# Altium project CarrierBoard-v1.0.PrjPcb (part 1 of 2)
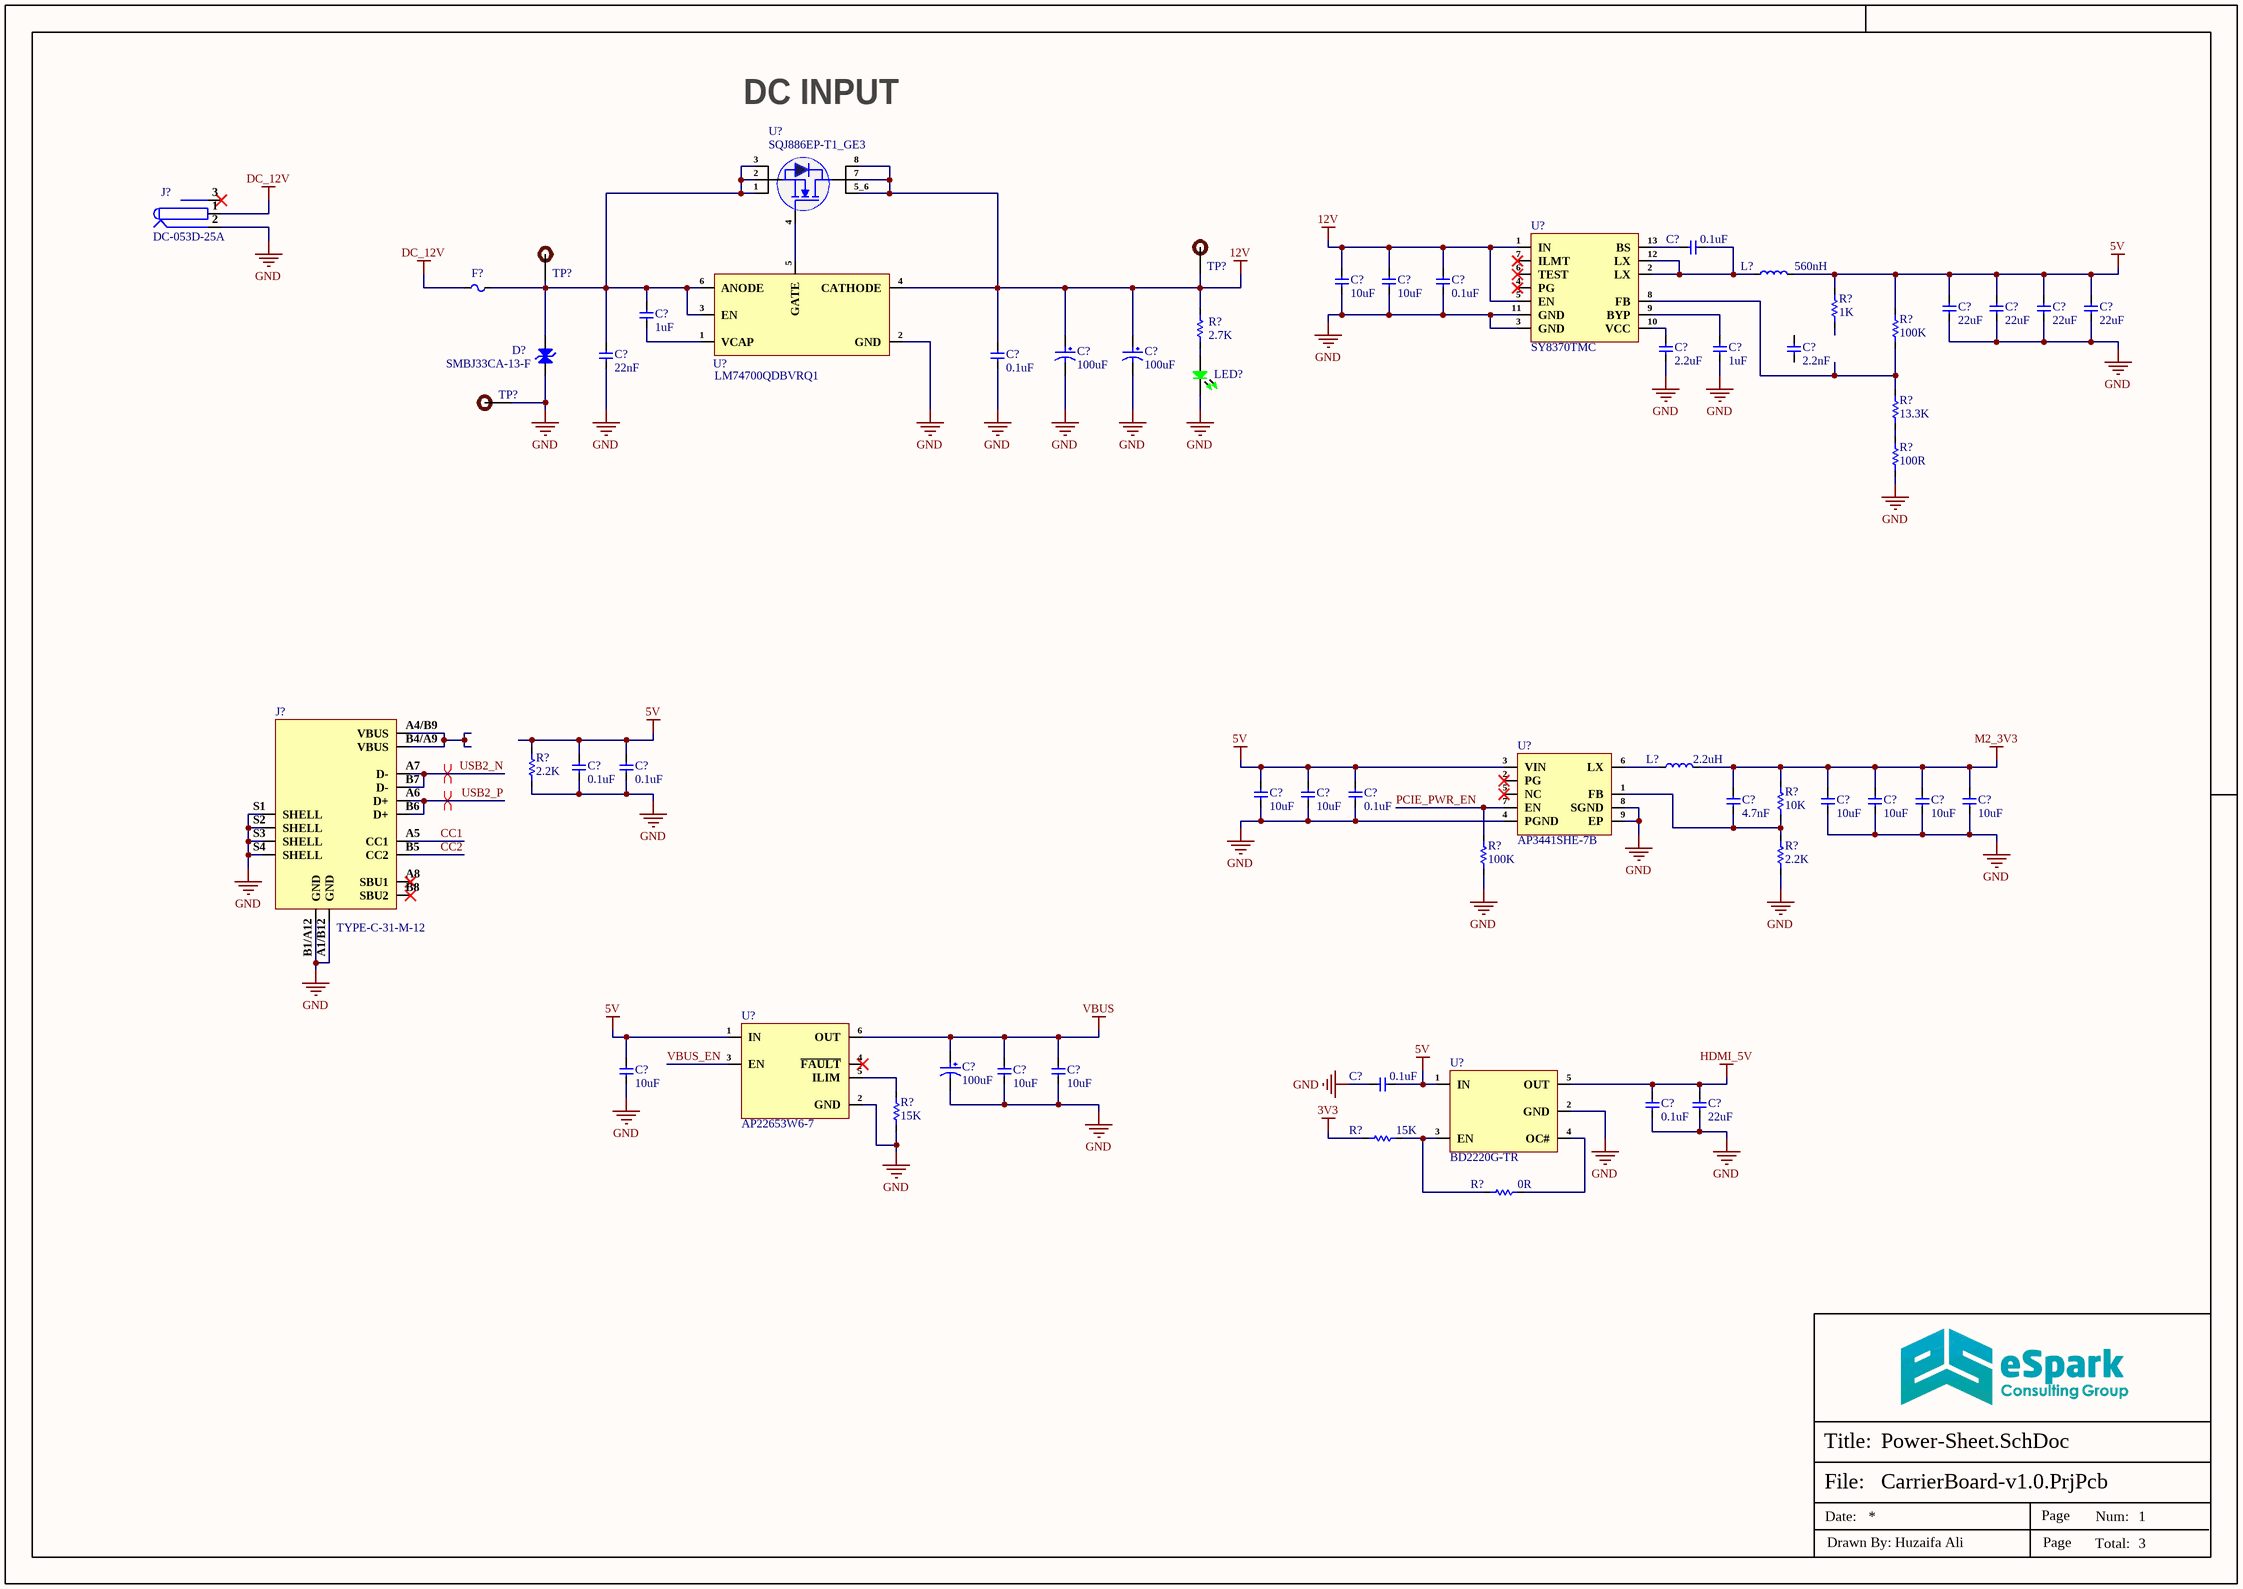
[diagram p0: Power-Sheet.SchDoc]
3 sheets, 66 parts. Net scope: global (net labels, ports and power ports of the same name join across sheets).
Sheets:
  Power-Sheet.SchDoc
  Compute-Module-Sheet-1.SchDoc
  Compute-Module-Sheet-2.SchDoc

## Sheet Power-Sheet.SchDoc
size 420 x 297 mm; SheetNumber: 1; SheetTotal: 3

### Parts
(Parts that share a designator on the sheet are numbered #1, #2 ... from top to bottom, then left to right.)
C?#1  0.1uF  [Cap-0402]
C?#2  10uF  [Cap-0805]
C?#3  10uF  [Cap-0805]
C?#4  0.1uF  [Cap-0402]
C?#5  22uF  [Cap-0805]
C?#6  22uF  [Cap-0805]
C?#7  22uF  [Cap-0805]
C?#8  22uF  [Cap-0805]
C?#9  1uF  [Cap-0402]
C?#10  100uF  [EEE-FK1E101XP]
C?#11  100uF  [EEE-FK1E101XP]
C?#12  2.2uF  [Cap-0402]
C?#13  0.1uF  [Cap-0402]
C?#14  1uF  [Cap-0402]
C?#15  2.2nF  [Cap-0402]
C?#16  22nF  [Cap-0603]
C?#17  0.1uF  [Cap-0402]
C?#18  0.1uF  [Cap-0402]
C?#19  10uF  [Cap-0805]
C?#20  10uF  [Cap-0805]
C?#21  0.1uF  [Cap-0402]
C?#22  4.7nF  [Cap-0402]
C?#23  10uF  [Cap-0805]
C?#24  10uF  [Cap-0805]
C?#25  10uF  [Cap-0805]
C?#26  10uF  [Cap-0805]
C?#27  100uF  [EEE-FK1E101XP]
C?#28  10uF  [Cap-0805]
C?#29  10uF  [Cap-0805]
C?#30  10uF  [Cap-0805]
C?#31  0.1uF  [Cap-0402]
C?#32  0.1uF  [Cap-0402]
C?#33  22uF  [Cap-0805]
D?  SMBJ33CA-13-F  [SMB Bi Directional]
F?  2920L500/16MR  [Fuse-2920]  (value not drawn)
J?#1  DC-053D-25A  [DC-053D-25A]
J?#2  TYPE-C-31-M-12  [TYPE-C-31-M-12_]
L?#1  560nH  [FAUL0630-R56MT]
L?#2  2.2uH  [HMS0603-2R2]
LED?  GREEN  [LED-0603]  (value not drawn)
R?#1  2.7K  [Res-0603]
R?#2  1K  [Res-0402]
R?#3  100K  [Res-0402]
R?#4  13.3K  [Res-0402]
R?#5  100R  [Res-0402]
R?#6  2.2K  [Res-0402]
R?#7  10K  [Res-0402]
R?#8  100K  [Res-0402]
R?#9  2.2K  [Res-0402]
R?#10  15K  [Res-0402]
R?#11  15K  [Res-0402]
R?#12  0R  [Res-0402]
TP?#1  TEST POINT  [Test-point]  (value not drawn)  (no BOM)
TP?#2  TEST POINT  [Test-point]  (value not drawn)  (no BOM)
TP?#3  TEST POINT  [Test-point]  (value not drawn)  (no BOM)
U?#1  SQJ886EP-T1_GE3  [PowerPAK-SO-8]
U?#2  SY8370TMC  [QFN-13(3x4)]
U?#3  LM74700QDBVRQ1  [SOT-23-6]
U?#4  AP3441SHE-7B  [DFN2020-8-EP]
U?#5  AP22653W6-7  [SOT-26]
U?#6  BD2220G-TR  [SSOP-5]

### Nets
3V3: R?#11.2
5V: C?#5.2 C?#6.2 C?#7.2 C?#8.2 C?#17.2 C?#18.2 C?#19.2 C?#20.2 C?#21.2 C?#28.2 C?#31.1 L?#1.2 R?#2.2 R?#3.2 R?#6.2 U?#4.3(VIN) U?#5.1(IN) U?#6.1(IN)
12V: C?#2.2 C?#3.2 C?#4.2 C?#10.1 C?#11.1 C?#13.2 R?#1.1 TP?#1.1 U?#1.5_6(D) U?#1.7(D) U?#1.8(D) U?#2.1(IN) U?#2.5(EN) U?#3.4(CATHODE)
DC_12V: F?.1 J?#1.1
GND: C?#2.1 C?#3.1 C?#4.1 C?#5.1 C?#6.1 C?#7.1 C?#8.1 C?#10.2 C?#11.2 C?#12.1 C?#13.1 C?#14.1 C?#16.1 C?#17.1 C?#18.1 C?#19.1 C?#20.1 C?#21.1 C?#23.1 C?#24.1 C?#25.1 C?#26.1 C?#27.2 C?#28.1 C?#29.1 C?#30.1 C?#31.2 C?#32.1 C?#33.1 D?.1(A) J?#1.2 J?#2.A1/B12(GND) J?#2.B1/A12(GND) J?#2.S1(SHELL) J?#2.S2(SHELL) J?#2.S3(SHELL) J?#2.S4(SHELL) LED?.2 R?#5.1 R?#6.1 R?#8.1 R?#9.1 R?#10.1 TP?#3.1 U?#2.3(GND) U?#2.11(GND) U?#3.2(GND) U?#4.4(PGND) U?#4.8(SGND) U?#4.9(EP) U?#5.2(GND) U?#6.2(GND)
HDMI_5V: C?#32.2 C?#33.2 U?#6.5(OUT)
M2_3V3: C?#22.2 C?#23.2 C?#24.2 C?#25.2 C?#26.2 L?#2.2 R?#7.2
VBUS: C?#27.1 C?#29.2 C?#30.2 U?#5.6(OUT)
CC1: J?#2.A5(CC1)
CC2: J?#2.B5(CC2)
PCIE_PWR_EN: R?#8.2 U?#4.7(EN)
USB2_N: J?#2.A7(D-) J?#2.B7(D-)
USB2_P: J?#2.A6(D+) J?#2.B6(D+)
VBUS_EN: U?#5.3(EN)
NetC?#1_1: C?#1.1 L?#1.1 U?#2.2(LX) U?#2.12(LX)
NetC?#1_2: C?#1.2 U?#2.13(BS)
NetC?#9_1: C?#9.1 U?#3.1(VCAP)
NetC?#9_2: C?#9.2 C?#16.2 D?.2(K) F?.2 TP?#2.1 U?#1.1(S) U?#1.2(S) U?#1.3(S) U?#3.3(EN) U?#3.6(ANODE)
NetC?#12_2: C?#12.2 U?#2.10(VCC)
NetC?#14_2: C?#14.2 U?#2.9(BYP)
NetC?#22_1: C?#22.1 R?#7.1 R?#9.2 U?#4.1(FB)
NetJ?#2_A4/B9: J?#2.A4/B9(VBUS) J?#2.B4/A9(VBUS)
NetL?#2_1: L?#2.1 U?#4.6(LX)
NetLED?_1: LED?.1 R?#1.2
NetR?#3_1: R?#3.1 R?#4.2 U?#2.8(FB)
NetR?#4_1: R?#4.1 R?#5.2
NetR?#10_2: R?#10.2 U?#5.5(ILIM)
NetR?#11_1: R?#11.1 R?#12.1 U?#6.3(EN)
NetR?#12_2: R?#12.2 U?#6.4(OC#)
NetU?#1_4: U?#1.4(G) U?#3.5(GATE)

Not connected (* = marked no-connect by the designer): C?#15 1 2; J?#1 3*; J?#2 A8(SBU1)* B8(SBU2)*; R?#2 1; U?#2 4(PG)* 6(TEST)* 7(ILMT)*; U?#4 2(PG)* 5(NC)*; U?#5 4(~{FAULT})*

### Layout directives
differential pair: USB2_N, USB2_P

### Notes on the sheet
- DC INPUT
- File:
- Title:
- Date:
- Page
- Num:
- Total:
- Drawn By: Huzaifa Ali

### Library data of the parts
C?#1 C?#4 C?#13 C?#17 C?#18 C?#21 C?#31 C?#32 = GCM155R71H104KE02D: CAP CER 0.1UF 50V X7R 0402; Manufacturer: Murata; Item Type: Capacitors; Material: 4241ConductorMaterial; Value: 100nF; Tolerance: 10%; Supplier: Mouser; LCSC Part Number: C85858; Manufacturer Part Number: GCM155R71H104KE02D; RoHS: Yes; Stock: 400191; Pricing: 1=0.1, 10=0.023, 50=0.023, 100=0.014, 1000=0.012, 10000=0.007 (USD); Mounting Technology: Surface Mount; Case/Package: 0402; Case Code (Metric): 1005; Case Code (Imperial): 0402; Weight: 0.000212oz; Min Operating Temperature: -55°C; Max Operating Temperature: 125°C; Packaging: Tape and Reel; Voltage Rating: 50V; Dielectric: X7R; Termination: SMD/SMT; Voltage Rating (DC): 50V; Package Quantity: 10000; Series: GCM; Length: 0.039inch; Width: 0.02inch; Height: 0.5mm; Thickness: 0.022inch; Ratings: AEC-Q200; Reach SVHC Compliant: No; RoHS Compliant: Yes; Lead Free: 5697LeadFree; ComponentLink1URL: http://www.farnell.com/datasheets/2079122.pdf?src-supplier=Farnell; ComponentLink1Description: http://www.farnell.com/datasheets/2079122.pdf?src-supplier=Farnell; ComponentLink2URL: http://www.mouser.com/ds/2/281/c03e-806517.pdf?src-supplier=Mouser; ComponentLink2Description: http://www.mouser.com/ds/2/281/c03e-806517.pdf?src-supplier=Mouser; ComponentLink3URL: https://datasheet.octopart.com/GCM155R71H104KE02D-Murata-datasheet-12524712.pdf?src-supplier=Future+Electronics; ComponentLink3Description: https://datasheet.octopart.com/GCM155R71H104KE02D-Murata-datasheet-12524712.pdf?src-supplier=Future+Electronics; ComponentLink4URL: http://search.murata.co.jp/Ceramy/image/img/A01X/partnumbering_e_02.pdf?src-supplier=Digikey; ComponentLink4Description: http://search.murata.co.jp/Ceramy/image/img/A01X/partnumbering_e_02.pdf?src-supplier=Digikey; ComponentLink5URL: https://datasheet.octopart.com/GCM155R71H104KE02D-Murata-datasheet-66077033.pdf?src-supplier=Element14; ComponentLink5Description: https://datasheet.octopart.com/GCM155R71H104KE02D-Murata-datasheet-66077033.pdf?src-supplier=Element14; ComponentLink6URL: https://datasheet.octopart.com/GCM155R71H104KE02D-Murata-datasheet-149522465.pdf?src-supplier=Farnell; ComponentLink6Description: https://datasheet.octopart.com/GCM155R71H104KE02D-Murata-datasheet-149522465.pdf?src-supplier=Farnell; ComponentLink7URL: http://www.farnell.com/datasheets/2079122.pdf?src-supplier=Element14; ComponentLink7Description: http://www.farnell.com/datasheets/2079122.pdf?src-supplier=Element14; ComponentLink8URL: http://www.farnell.com/datasheets/2079122.pdf?src-supplier=Newark; ComponentLink8Description: http://www.farnell.com/datasheets/2079122.pdf?src-supplier=Newark; ComponentLink9URL: https://datasheet.octopart.com/GCM155R71H104KE02D-Murata-datasheet-165579661.pdf?src-supplier=TME; ComponentLink9Description: https://datasheet.octopart.com/GCM155R71H104KE02D-Murata-datasheet-165579661.pdf?src-supplier=TME
C?#2 C?#3 C?#19 C?#20 C?#23-C?#26 C?#28-C?#30 = GRM21BZ71E106KE15L: CAP CER 10UF 25V X7R 0805; Manufacturer: Murata; Item Type: Capacitors; Material: 4241ConductorMaterial; Tolerance: 10%; Supplier: Mouser; LCSC Part Number: C237493; Manufacturer Part Number: GRM21BZ71E106KE15L; RoHS: Yes; Stock: 43117; Pricing: 1=0.34, 10=0.142, 50=0.142, 100=0.096, 1000=0.086, 10000=0.058 (USD); Case/Package: 339Case; Min Operating Temperature: -55°C; Max Operating Temperature: 125°C; Value: 10uF; Voltage Rating: 25V; Length: 2mm; Width: 1.25mm; Height: 1.45mm; Thickness: 1.25mm; RoHS Compliant: Yes
C?#5-C?#8 C?#33 = GRM21BZ71A226ME15L: CAP CER 22UF 10V X7R 0805; Manufacturer: Murata; Material: 4241ConductorMaterial; Tolerance: 20%; Item Type: Capacitor; Supplier: Digi-Key; Supplier Part Number: 490-GRM21BZ71A226ME15LCT-ND; Manufacturer Part Number: GRM21BZ71A226ME15L; RoHS: Yes; Category: Ceramic Capacitors; Stock: 49126; Pricing: 1=0.39, 10=0.259, 50=0.191, 100=0.1556, 500=0.12282, 1000=0.10372 (USD); Package: 0805; Min Operating Temperature: -55°C; Max Operating Temperature: 125°C; Value: 22uF; Voltage Rating: 10V; Length: 2mm; Width: 1.25mm; Height: 1.45mm; Thickness: 1.25mm; ComponentLink1URL: https://datasheet.octopart.com/GRM21BZ71A226ME15L-Murata-datasheet-165579666.pdf?src-supplier=TME; ComponentLink1Description: https://datasheet.octopart.com/GRM21BZ71A226ME15L-Murata-datasheet-165579666.pdf?src-supplier=TME; LCSC Part Number: C907991; ComponentLink2Description: LCSC; ComponentLink2URL: https://www.lcsc.com/product-detail/Multilayer-Ceramic-Capacitors-MLCC-SMD-SMT_Murata-Electronics-GRM21BZ71A226ME15L_C907991.html
C?#9 C?#14 = CC0402KRX5R8BB105: CAP CER 1UF 25V X5R 0402; Manufacturer: Yageo; Tolerance: 10%; Supplier 1: Mouser; Manufacturer Part Number: CC0402KRX5R8BB105; RoHS: Yes; Category: Ceramic Capacitors; Stock 1: 91975; Pricing 1: 1=0.30000, 10=0.20400, 50=0.20400, 100=0.11600, 1000=0.07200, 10000=0.05900 (USD); Mount: Surface Mount; Case/Package: 0402; Case Code (Metric): 1005; Case Code (Imperial): 0402; Weight: 2.3E-05oz; Min Operating Temperature: -55°C; Max Operating Temperature: 85°C; Packaging: Tape and Reel; Capacitance: 1uF; Voltage Rating: 25V; Dielectric: X5R; Termination: SMD/SMT; Voltage Rating (DC): 25V; Package Quantity: 10000; Length: 0.039inch; Width: 0.02inch; Thickness: 0.022inch; Lead Free: Lead Free; Halogen Free: Halogen Free; RoHS Compliant: Yes; ComponentLink1URL: http://www.mouser.com/ds/2/447/Yageo_UPY-GP_NP0_16V-to-50V_9-358835.pdf?src-supplier=Mouser; ComponentLink1Description: http://www.mouser.com/ds/2/447/Yageo_UPY-GP_NP0_16V-to-50V_9-358835.pdf?src-supplier=Mouser; ComponentLink2URL: http://www.yageo.com/documents/recent/UPY-GPHC_X5R_4V-to-50V_25.pdf?src-supplier=Digi-Key; ComponentLink2Description: http://www.yageo.com/documents/recent/UPY-GPHC_X5R_4V-to-50V_25.pdf?src-supplier=Digi-Key; ComponentLink3URL: https://4donline.ihs.com/images/VipMasterIC/IC/YAGO/YAGO-S-A0006851646/YAGO-S-A0006851646-1.pdf?hkey=6D3A4C79FDBF58556ACFDE234799DDF0&src-supplier=Newark; ComponentLink3Description: https://4donline.ihs.com/images/VipMasterIC/IC/YAGO/YAGO-S-A0006851646/YAGO-S-A0006851646-1.pdf?hkey=6D3A4C79FDBF58556ACFDE234799DDF0&src-supplier=Newark; Supplier Part Number 1: 603-CC402KRX5R8BB105; LCSC Part Number: C326568
C?#10 C?#11 C?#27 = EEE-FK1E101XP: CAP ALUM 100UF 20% 25V SMD; Manufacturer: Panasonic; Item Type: Capacitor; Ripple Current: 280mA; ESR (Equivalent Series Resistance): 340mR; Life (Hours): 2000Hour; Leakage Current: 3uA; Lead Diameter: 0.65mm; Supplier: Mouser; LCSC Part Number: C128510; Manufacturer Part Number: EEE-FK1E101XP; RoHS: Yes; Stock: 18001; Pricing: 1=0.56, 10=0.293, 50=0.293, 100=0.263, 1000=0.168, 10000=0.147 (USD); Mounting Technology: Surface Mount,PCB; Case/Package: Radial; Pins: 8; Min Operating Temperature: -55°C; Max Operating Temperature: 105°C; Tolerance: 20%; Value: 100uF; Voltage Rating (DC): 25V; Packaging: Tape and Reel; Voltage Rating: 25V; Ripple Current (AC): 280mA; Impedance: 340mR; Package Quantity: 1; Termination: SMD/SMT; Voltage: 25V; Series: FK; Construction: Cylindrical; Diameter: 6.3mm; Length: 7.7mm; Width: 7.8mm; Height: 7.7mm; Lead Pitch: 1.8mm; Height - Seated (Max): 0.303inch; Ratings: AEC-Q200; Radiation Hardening: No; Reach SVHC Compliant: No; RoHS Compliant: Yes; Lead Free: 5697LeadFree; ComponentLink1URL: https://datasheet.ciiva.com/11777/0900766b80e4e8b0-11777232.pdf?src-supplier=Rs; ComponentLink1Description: https://datasheet.ciiva.com/11777/0900766b80e4e8b0-11777232.pdf?src-supplier=Rs; ComponentLink2URL: https://datasheet.ciiva.com/2983/aba0000ce120-2983949.pdf?src-supplier=Avnet; ComponentLink2Description: https://datasheet.ciiva.com/2983/aba0000ce120-2983949.pdf?src-supplier=Avnet; ComponentLink3URL: https://datasheet.ciiva.com/46386/1676921-46386184.pdf?src-supplier=Element14; ComponentLink3Description: https://datasheet.ciiva.com/46386/1676921-46386184.pdf?src-supplier=Element14; ComponentLink4URL: https://datasheet.ciiva.com/46376/1676921-46376486.pdf?src-supplier=Element14; ComponentLink4Description: https://datasheet.ciiva.com/46376/1676921-46376486.pdf?src-supplier=Element14; ComponentLink5URL: https://datasheet.ciiva.com/43463/58258-43463513.pdf?src-supplier=Farnell; ComponentLink5Description: https://datasheet.ciiva.com/43463/58258-43463513.pdf?src-supplier=Farnell; ComponentLink6URL: https://datasheet.ciiva.com/46386/58258-46386183.pdf?src-supplier=Element14; ComponentLink6Description: https://datasheet.ciiva.com/46386/58258-46386183.pdf?src-supplier=Element14; ComponentLink7URL: https://datasheet.ciiva.com/28678/731857-28678871.pdf?src-supplier=Element14; ComponentLink7Description: https://datasheet.ciiva.com/28678/731857-28678871.pdf?src-supplier=Element14; ComponentLink8URL: https://datasheet.ciiva.com/24023/aba0000ce120-24023434.pdf?src-supplier=Mouser; ComponentLink8Description: https://datasheet.ciiva.com/24023/aba0000ce120-24023434.pdf?src-supplier=Mouser; ComponentLink9URL: https://datasheet.ciiva.com/14594/70258115-14594399.pdf?src-supplier=Allied+Electronics; ComponentLink9Description: https://datasheet.ciiva.com/14594/70258115-14594399.pdf?src-supplier=Allied+Electronics; ComponentLink10URL: https://datasheet.ciiva.com/2983/aba0000ce120-2983950.pdf?src-supplier=Avnet; ComponentLink10Description: https://datasheet.ciiva.com/2983/aba0000ce120-2983950.pdf?src-supplier=Avnet; ComponentLink11URL: https://datasheet.ciiva.com/16449/aba0000ce120-16449109.pdf?src-supplier=Future+Electronics; ComponentLink11Description: https://datasheet.ciiva.com/16449/aba0000ce120-16449109.pdf?src-supplier=Future+Electronics
C?#12 = GRM155R61C225KE11D: CAP CER 2.2UF 16V X5R 0402; Manufacturer: Murata; Item Type: Capacitors; Material: Ceramic; Tolerance: 10%; Supplier: Future Electronics; LCSC Part Number: C88944; Manufacturer Part Number: GRM155R61C225KE11D; RoHS: Yes; Stock: 80000; Pricing: 10000=0.0294, 20000=0.0289, 30000=0.0287, 40000=0.0285, 50000=0.0279 (USD); Mounting Technology: Surface Mount; Case/Package: 0402; Case Code (Metric): 1005; Case Code (Imperial): 0402; Min Operating Temperature: -55°C; Max Operating Temperature: 85°C; Value: 2.2uF; Packaging: Cut Tape; Voltage Rating: 16V; Voltage Rating (DC): 16V; Series: GRM; Length: 0.039inch; Width: 0.02inch; Height: 0.3mm; Thickness: 0.022inch; Lead Free: Lead Free; RoHS Compliant: Yes; ComponentLink1URL: http://www.mouser.com/ds/2/281/c02e-2905.pdf?src-supplier=Mouser; ComponentLink1Description: http://www.mouser.com/ds/2/281/c02e-2905.pdf?src-supplier=Mouser; ComponentLink2URL: https://datasheet.octopart.com/GRM155R61C225KE11D-Murata-datasheet-149522998.pdf?src-supplier=Newark; ComponentLink2Description: https://datasheet.octopart.com/GRM155R61C225KE11D-Murata-datasheet-149522998.pdf?src-supplier=Newark; ComponentLink3URL: https://datasheet.octopart.com/GRM155R61C225KE11D-Murata-datasheet-66001083.pdf?src-supplier=Future+Electronics; ComponentLink3Description: https://datasheet.octopart.com/GRM155R61C225KE11D-Murata-datasheet-66001083.pdf?src-supplier=Future+Electronics; ComponentLink4URL: https://search.murata.co.jp/Ceramy/image/img/A01X/G101/ENG/GRM155R61C225KE11-01.pdf?src-supplier=Digikey; ComponentLink4Description: https://search.murata.co.jp/Ceramy/image/img/A01X/G101/ENG/GRM155R61C225KE11-01.pdf?src-supplier=Digikey; ComponentLink5URL: https://datasheet.octopart.com/GRM155R61C225KE11D-Murata-datasheet-165579666.pdf?src-supplier=TME; ComponentLink5Description: https://datasheet.octopart.com/GRM155R61C225KE11D-Murata-datasheet-165579666.pdf?src-supplier=TME
C?#15 = 04025C222JAT2A: CAP CER 2.2nF 50V X7R ±5% 0402 MLCC - SMD/SMT ROHS; Manufacturer: Kyocera AVX; Item Type: Capacitor; Manufacturer Part Number: 04025C222JAT2A; Package: 0402; LCSC Part Number: C597041; ComponentLink1Description: LCSC; ComponentLink1URL: https://www.lcsc.com/product-detail/Multilayer-Ceramic-Capacitors-MLCC-SMD-SMT_Kyocera-AVX-04025C222JAT2A_C597041.html
C?#16 = CC0603KRX7R9BB223: CAP CER 0.022UF 50V X7R 0603; Manufacturer: Yageo; Dielectric Material: Ceramic; Tolerance: 10%; Insulation Resistance: 100GR; Item Type: Capacitor; Supplier 1: Digi-Key; Manufacturer Part Number: CC0603KRX7R9BB223; RoHS: Yes; Category: Ceramic Capacitors; Stock 1: 119735; Pricing 1: 1=0.10000, 10=0.05500, 50=0.03020, 100=0.02460, 500=0.01760, 1000=0.01383 (USD); Mount: Surface Mount; Case/Package: 0603; Number of Pins: 2; Case Code (Metric): 1608; Case Code (Imperial): 0603; Min Operating Temperature: -55°C; Max Operating Temperature: 125°C; Capacitance: 22nF; Dielectric: X7R; Voltage: 50V; Package Quantity: 1; Voltage Rating: 50V; Packaging: Tape and Reel; Voltage Rating (DC): 50V; Termination: SMD/SMT; Resistor Type: Ceramic; Series: CC; Length: 1.6mm; Width: 0.031inch; Height: 0.8mm; Depth: 0.8mm; Thickness: 0.035inch; Radiation Hardening: No; RoHS Compliant: Yes; REACH SVHC: No SVHC; Lead Free: Lead Free; Halogen Free: Halogen Free; ComponentLink1URL: https://datasheet.ciiva.com/8033/70765-8033869.pdf?src-supplier=Element14; ComponentLink1Description: https://datasheet.ciiva.com/8033/70765-8033869.pdf?src-supplier=Element14; ComponentLink2URL: https://datasheet.ciiva.com/28450/1489800-28450639.pdf?src-supplier=Element14; ComponentLink2Description: https://datasheet.ciiva.com/28450/1489800-28450639.pdf?src-supplier=Element14; ComponentLink3URL: https://datasheet.ciiva.com/8033/1489800-8033867.pdf?src-supplier=Element14; ComponentLink3Description: https://datasheet.ciiva.com/8033/1489800-8033867.pdf?src-supplier=Element14; ComponentLink4URL: https://datasheet.ciiva.com/8033/1489800-8033865.pdf?src-supplier=Element14; ComponentLink4Description: https://datasheet.ciiva.com/8033/1489800-8033865.pdf?src-supplier=Element14; ComponentLink5URL: https://datasheet.ciiva.com/156/mlccorderingcode-156178.pdf?src-supplier=Digi-Key; ComponentLink5Description: https://datasheet.ciiva.com/156/mlccorderingcode-156178.pdf?src-supplier=Digi-Key; ComponentLink6URL: https://datasheet.ciiva.com/156/mlccorderingcode-156177.pdf?src-supplier=Digi-Key; ComponentLink6Description: https://datasheet.ciiva.com/156/mlccorderingcode-156177.pdf?src-supplier=Digi-Key; ComponentLink7URL: https://datasheet.ciiva.com/156/mlccorderingcode-156179.pdf?src-supplier=Digi-Key; ComponentLink7Description: https://datasheet.ciiva.com/156/mlccorderingcode-156179.pdf?src-supplier=Digi-Key; ComponentLink8URL: https://datasheet.ciiva.com/11464/upy-gphc-x7r-6-3v-to-50v-8-11464741.pdf?src-supplier=Avnet; ComponentLink8Description: https://datasheet.ciiva.com/11464/upy-gphc-x7r-6-3v-to-50v-8-11464741.pdf?src-supplier=Avnet; Supplier Part Number 1: 311-1370-1-ND; LCSC Part Number: C106222
C?#22 = CC0402KRX7R9BB472: CAP CER 4700PF 50V X7R 0402; Manufacturer: Yageo; Material: 4241ConductorMaterial; Tolerance: 10%; Temperature Coefficient: 30ppm/°C; Item Type: Capacitor; Supplier 1: Future Electronics; Manufacturer Part Number: CC0402KRX7R9BB472; RoHS: Yes; LCSC Part Number: C106208; Stock 1: 1780000; Pricing 1: 10000=0.0021, 40000=0.002, 150000=0.0019, 400000=0.0018, 1000000=0.0017 (USD); Mount: Surface Mount; Case/Package: 0402; Number of Pins: 2NUMBER; Case Code (Imperial): 0402; Case Code (Metric): 1005; Min Operating Temperature: -55°C; Max Operating Temperature: 125°C; Capacitance: 4.7nF; Dielectric: X7R; Voltage Rating: 50V; Voltage Rating (DC): 50V; Packaging: Tape and Reel; Package Quantity: 1; Termination: SMD/SMT; Series: CC; Construction: Flat; Length: 1mm; Width: 0.02inch; Height: 0.5mm; Thickness: 0.022inch; Depth: 0.5mm; Radiation Hardening: No; Reach SVHC Compliant: No; RoHS Compliant: Yes; Halogen Free: 5694HalogenFree; Lead Free: 5697LeadFree; ComponentLink1URL: https://datasheet.ciiva.com/7978/1489800-7978108.pdf?src-supplier=Element14; ComponentLink1Description: https://datasheet.ciiva.com/7978/1489800-7978108.pdf?src-supplier=Element14; ComponentLink2URL: https://datasheet.ciiva.com/176/mlccorderingcode-176364.pdf?src-supplier=Digikey; ComponentLink2Description: https://datasheet.ciiva.com/176/mlccorderingcode-176364.pdf?src-supplier=Digikey; ComponentLink3URL: https://datasheet.ciiva.com/176/mlccorderingcode-176363.pdf?src-supplier=Digikey; ComponentLink3Description: https://datasheet.ciiva.com/176/mlccorderingcode-176363.pdf?src-supplier=Digikey; ComponentLink4URL: https://datasheet.ciiva.com/176/mlccorderingcode-176365.pdf?src-supplier=Digikey; ComponentLink4Description: https://datasheet.ciiva.com/176/mlccorderingcode-176365.pdf?src-supplier=Digikey; ComponentLink5URL: https://datasheet.ciiva.com/11586/upy-gphc-x7r-6-3v-to-50v-8-11586491.pdf?src-supplier=Avnet; ComponentLink5Description: https://datasheet.ciiva.com/11586/upy-gphc-x7r-6-3v-to-50v-8-11586491.pdf?src-supplier=Avnet; Supplier Part Number 1: 1989300
D? = SMBJ33CA-13-F: TVS DIODE 33VWM 53.3VC SMB; Manufacturer: Diodes; Supplier: Future Electronics; Supplier Part Number: 2822294; Manufacturer Part Number: SMBJ33CA-13-F; RoHS: Yes; Category: TVS Diodes; Stock: 33000; Pricing: 3000=0.0754, 9000=0.0725, 15000=0.0712, 30000=0.0695, 60000=0.0668 (USD); ComponentLink1URL: https://datasheet.ciiva.com/335/ds19002-335120.pdf?src-supplier=Avnet; ComponentLink1Description: https://datasheet.ciiva.com/335/ds19002-335120.pdf?src-supplier=Avnet; ComponentLink2URL: https://datasheet.ciiva.com/15143/getdatasheetpartid-139973-15143680.pdf?src-supplier=Verical; ComponentLink2Description: https://datasheet.ciiva.com/15143/getdatasheetpartid-139973-15143680.pdf?src-supplier=Verical; ComponentLink3URL: https://datasheet.ciiva.com/16353/ds19002-16353960.pdf?src-supplier=Future+Electronics; ComponentLink3Description: https://datasheet.ciiva.com/16353/ds19002-16353960.pdf?src-supplier=Future+Electronics; LCSC Part Number: C135068; Item Type: Diode
F? = 2920L500/16MR: PTC RESET FUSE 16V 5A 2920; Manufacturer: Littelfuse; Item Type: Fuses; Current Rating: 40A; Power Dissipation: 2W; Supplier: Digikey; LCSC Part Number: C207091; Manufacturer Part Number: 2920L500/16MR; RoHS: Yes; Stock: 10184; Pricing: 1=1.76, 5=1.462, 10=1.349, 50=1.1192, 100=1.0326, 250=0.92788, 500=0.85544 (USD); ComponentLink1URL: http://www.farnell.com/datasheets/2282560.pdf?src-supplier=Farnell; ComponentLink1Description: http://www.farnell.com/datasheets/2282560.pdf?src-supplier=Farnell; ComponentLink2URL: http://www.littelfuse.com/~/media/electronics/datasheets/resettable_ptcs/littelfuse_ptc_2920l_datasheet.pdf.pdf?src-supplier=Mouser; ComponentLink2Description: http://www.littelfuse.com/~/media/electronics/datasheets/resettable_ptcs/littelfuse_ptc_2920l_datasheet.pdf.pdf?src-supplier=Mouser; ComponentLink3URL: http://www.littelfuse.com/~/media/electronics/datasheets/resettable_ptcs/littelfuse_ptc_2920l_datasheet.pdf.pdf?src-supplier=Arrow+Electronics; ComponentLink3Description: http://www.littelfuse.com/~/media/electronics/datasheets/resettable_ptcs/littelfuse_ptc_2920l_datasheet.pdf.pdf?src-supplier=Arrow+Electronics; ComponentLink4URL: http://www.littelfuse.com/~/media/electronics/datasheets/resettable_ptcs/littelfuse_ptc_2920l_datasheet.pdf.pdf?src-supplier=Digikey; ComponentLink4Description: http://www.littelfuse.com/~/media/electronics/datasheets/resettable_ptcs/littelfuse_ptc_2920l_datasheet.pdf.pdf?src-supplier=Digikey; ComponentLink5URL: https://www.littelfuse.com/~/media/electronics/datasheets/resettable_ptcs/littelfuse_ptc_2920l_datasheet.pdf.pdf?src-supplier=Digikey; ComponentLink5Description: https://www.littelfuse.com/~/media/electronics/datasheets/resettable_ptcs/littelfuse_ptc_2920l_datasheet.pdf.pdf?src-supplier=Digikey; ComponentLink6URL: http://www.farnell.com/datasheets/2140491.pdf?src-supplier=Element14; ComponentLink6Description: http://www.farnell.com/datasheets/2140491.pdf?src-supplier=Element14; ComponentLink7URL: http://www.littelfuse.com/~/media/electronics/datasheets/resettable_ptcs/littelfuse_ptc_2920l_datasheet.pdf.pdf?src-supplier=Verical; ComponentLink7Description: http://www.littelfuse.com/~/media/electronics/datasheets/resettable_ptcs/littelfuse_ptc_2920l_datasheet.pdf.pdf?src-supplier=Verical; ComponentLink8URL: http://www.littelfuse.com/~/media/electronics/datasheets/resettable_ptcs/littelfuse_ptc_2920l_datasheet.pdf.pdf?src-supplier=Quest; ComponentLink8Description: http://www.littelfuse.com/~/media/electronics/datasheets/resettable_ptcs/littelfuse_ptc_2920l_datasheet.pdf.pdf?src-supplier=Quest; ComponentLink9URL: http://www.littelfuse.com/~/media/electronics/datasheets/resettable_ptcs/littelfuse_ptc_2920l_datasheet.pdf.pdf?src-supplier=TTI; ComponentLink9Description: http://www.littelfuse.com/~/media/electronics/datasheets/resettable_ptcs/littelfuse_ptc_2920l_datasheet.pdf.pdf?src-supplier=TTI
J?#1 = DC-053D-25A: Shrouded DC Power Receptacle -20℃~+70℃ 2.5mm 6.5mm 10A 16V Plugin AC/DC Power Connectors ROHS; Manufacturer: Korean Hroparts Elec; Item Type: DC JACK; Manufacturer Part Number: DC-053D-25A; Package: Custom; LCSC Part Number: C2686352; ComponentLink1Description: LCSC; ComponentLink1URL: https://www.lcsc.com/product-detail/AC-DC-Power-Connectors_Korean-Hroparts-Elec-DC-053D-25A_C2686352.html
J?#2 = TYPE-C-31-M-12: 5A 1 16P Female Type-C SMD USB Connectors ROHS; Manufacturer: Korean Hroparts Elec; ComponentLink1Description: LCSC; ComponentLink1URL: https://www.lcsc.com/product-detail/USB-Connectors_Korean-Hroparts-Elec-TYPE-C-31-M-12_C165948.html; Manufacturer Part Number: TYPE-C-31-M-12; Footprint: Custom; LCSC Part Number: C165948; Item Type: USB Connector
L?#1 = FAUL0630-R56MT: 16.5A 560nH ±20% 18A SMD,6.6x7mm Power Inductors ROHS; Manufacturer: cjiang (Changjiang Microelectronics Tech); Manufacturer Part Number: FAUL0630-R56MT; Package: SMD,6.6x7mm; LCSC Part Number: C3040346; Item Type: Inductor; ComponentLink1Description: LCSC; ComponentLink1URL: https://www.lcsc.com/product-detail/Power-Inductors_cjiang-Changjiang-Microelectronics-Tech-FAUL0630-R56MT_C3040346.html
L?#2 = HMS0603-2R2: 8A 2.2uH Integrated molded inductor 10A SMD,7.4x6.6mm Power Inductors ROHS; Manufacturer: ZE; Manufacturer Part Number: HMS0603-2R2; Package: SMD,7.4x6.6mm; LCSC Part Number: C967697; Item Type: Inductor; ComponentLink1Description: LCSC; ComponentLink1URL: https://www.lcsc.com/product-detail/Power-Inductors_ZE-HMS0603-2R2_C967697.html
LED? = NCD0603G2: Emerald 0603 Light Emitting Diodes (LED) ROHS; Manufacturer: Foshan NationStar Optoelectronics; Manufacturer Part Number: NCD0603G2; Package: 0603; LCSC Part Number: C87326; Item Type: LED; ComponentLink1Description: LCSC; ComponentLink1URL: https://www.lcsc.com/product-detail/Light-Emitting-Diodes-LED_Foshan-NationStar-Optoelectronics-NCD0603G2_C87326.html
R?#1 = RC0603FR-072K7L: RES 2.7K OHM 1% 1/10W 0603; Manufacturer: Yageo; Resistance: 2.7kR; Voltage Rating (DC): 50V; Temperature Coefficient: 100ppm/°C; Power Rating: 100mW; Item Type: Resistor; Manufacturer Part Number: RC0603FR-072K7L; RoHS: Yes; Category: Chip SMD Resistors; Supplier 1: Avnet; Stock 1: 5000; Pricing 1: 5000=0.00133, 10000=0.00131, 20000=0.00127 (USD); Case/Package: 0603; Number of Pins: 2; Case Code (Imperial): 0603; Case Code (Metric): 1608; Size Code: 0603; Min Operating Temperature: -55°C; Max Operating Temperature: 155°C; Tolerance: 1%; Packaging: Tape and Reel; Resistor Type: Thick Film; Voltage Rating: 50V; Package Quantity: 1; Termination: SMD/SMT; Number of Terminations: 2; Max Power Dissipation: 100mW; Features: Moisture Resistant; Series: RC; Resistance Tolerance: 1%; Construction: Rectangular; Length: 0.063inch; Width: 0.031inch; Height: 0.022inch; Depth: 0.8mm; Reach SVHC Compliant: Yes; Lead Free: Lead Free; Military Standard: Not; RoHS Compliant: Yes; Supplier Part Number 1: RC0603FR-072K7L; LCSC Part Number: C114612
R?#2 = RC0402FR-071KL: RES 1K OHM 1% 1/16W 0402; Manufacturer: Yageo; Resistance: 1kR; Temperature Coefficient: 100ppm/°C; Voltage Rating (DC): 50V; Power Rating: 62.5mW; Max Power Dissipation: 63mW; Item Type: Resistor; Supplier 1: Avnet; Manufacturer Part Number: RC0402FR-071KL; RoHS: Yes; Category: Chip SMD Resistors; Stock 1: 13030000; Pricing 1: 10000=0.00085, 20000=0.00087, 40000=0.00084, 60000=0.00083, 80000=0.00079, 100000=0.00078, 1000000=0.00076 (USD); Case/Package: 0402; Number of Pins: 2; Case Code (Imperial): 0402; Case Code (Metric): 1005; Size Code: 0402; Min Operating Temperature: -55°C; Max Operating Temperature: 155°C; Resistor Type: Thick Film; Tolerance: 1%; Packaging: Tape and Reel; Voltage Rating: 50V; Termination: SMD/SMT; Features: Moisture Resistant; Series: RC; Number of Terminations: 2; Resistance Tolerance: 1%; Construction: Rectangular; Technology: THICK FILM; Length: 1mm; Width: 0.5mm; Height: 0.32mm; Depth: 0.5mm; Reach SVHC Compliant: Yes; Lead Free: Lead Free; RoHS Compliant: Yes; Military Standard: Not; ComponentLink1URL: https://datasheet.ciiva.com/11819/0900766b80c66297-11819477.pdf?src-supplier=RSComponents; ComponentLink1Description: https://datasheet.ciiva.com/11819/0900766b80c66297-11819477.pdf?src-supplier=RSComponents; ComponentLink2URL: https://datasheet.ciiva.com/7983/1018594-7983502.pdf?src-supplier=Element14; ComponentLink2Description: https://datasheet.ciiva.com/7983/1018594-7983502.pdf?src-supplier=Element14; ComponentLink3URL: https://datasheet.ciiva.com/22747/1018594-22747513.pdf?src-supplier=Element14; ComponentLink3Description: https://datasheet.ciiva.com/22747/1018594-22747513.pdf?src-supplier=Element14; ComponentLink4URL: https://datasheet.ciiva.com/12666/pyu-rc0402-51-rohs-l-6-r-12666741.pdf?src-supplier=Mouser; ComponentLink4Description: https://datasheet.ciiva.com/12666/pyu-rc0402-51-rohs-l-6-r-12666741.pdf?src-supplier=Mouser; ComponentLink5URL: https://datasheet.ciiva.com/7849/1018594-7849869.pdf?src-supplier=Element14; ComponentLink5Description: https://datasheet.ciiva.com/7849/1018594-7849869.pdf?src-supplier=Element14; ComponentLink6URL: https://datasheet.ciiva.com/7849/1018594-7849871.pdf?src-supplier=Element14; ComponentLink6Description: https://datasheet.ciiva.com/7849/1018594-7849871.pdf?src-supplier=Element14; ComponentLink7URL: https://datasheet.ciiva.com/17063/pyu-rc0402-51-rohs-l-6-r-17063193.pdf?src-supplier=Future+Electronics; ComponentLink7Description: https://datasheet.ciiva.com/17063/pyu-rc0402-51-rohs-l-6-r-17063193.pdf?src-supplier=Future+Electronics; Supplier Part Number 1: RC0402FR-071KL; LCSC Part Number: C106235
R?#3 R?#8 = RT0402BRD07100KL: RES SMD 100K OHM 0.1% 1/16W 0402; Manufacturer: Yageo; Voltage Rating (DC): 50V; Item Type: Resistor; Supplier: Digikey; Supplier Part Number: YAG1343CT-ND; Manufacturer Part Number: RT0402BRD07100KL; RoHS: Yes; Category: Chip SMD Resistors; Stock: 62932; Pricing: 1=0.16, 10=0.121, 50=0.0958, 100=0.0859, 500=0.0654, 1000=0.0578, 5000=0.04283 (USD); ComponentLink1URL: https://datasheet.ciiva.com/12724/pyu-rt-1-to-0-05-rohs-l-4-12724954.pdf?src-supplier=Mouser; ComponentLink1Description: https://datasheet.ciiva.com/12724/pyu-rt-1-to-0-05-rohs-l-4-12724954.pdf?src-supplier=Mouser; LCSC Part Number: C852472
R?#4 = RT0402BRD0713K3L: RES SMD 13.3KOHM 0.1% 1/16W 0402; Manufacturer: Yageo; Item Type: Resistors; Voltage Rating: 50V; Value: 13.3kR; Power Rating: 62.5mW; Temperature Coefficient: 25ppm/°C; Max Power Dissipation: 63mW; Supplier: Digikey; LCSC Part Number: C852521; Manufacturer Part Number: RT0402BRD0713K3L; RoHS: Yes; Stock: 21241; Pricing: 1=0.16, 10=0.124, 50=0.099, 100=0.0887, 500=0.06732, 1000=0.05916, 5000=0.04386 (USD); Case/Package: 0402; Case Code (Metric): 1005; Case Code (Imperial): 0402; Min Operating Temperature: -55°C; Max Operating Temperature: 155°C; Tolerance: 0.1%; Packaging: Tape and Reel; Termination: SMD/SMT; Number of Terminations: 2; Voltage Rating (DC): 50V; Features: Moisture Resistant; Series: RT; Length: 0.039inch; Width: 0.02inch; Height: 0.014inch; Lead Free: Lead Free; RoHS Compliant: Yes; ComponentLink1URL: https://datasheet.ciiva.com/12721/pyu-rt-1-to-0-05-rohs-l-4-12721717.pdf?src-supplier=Mouser; ComponentLink1Description: https://datasheet.ciiva.com/12721/pyu-rt-1-to-0-05-rohs-l-4-12721717.pdf?src-supplier=Mouser
R?#5 = RC0402FR-07100RL: RES 100 OHM 1% 1/16W 0402; Manufacturer: Yageo; Power Rating: 62.5mW; Voltage Rating: 50V; Temperature Coefficient: 100ppm/°C; Max Power Dissipation: 63mW; Item Type: Resistor; Supplier 1: Mouser; Manufacturer Part Number: RC0402FR-07100RL; RoHS: Yes; Category: Chip SMD Resistors; Stock 1: 699545; Pricing 1: 1=0.10000, 10=0.01200, 50=0.01200, 100=0.00500, 1000=0.00300, 2500=0.00200, 10000=0.00100 (USD); Case/Package: 0402; Number of Pins: 2; Case Code (Imperial): 0402; Case Code (Metric): 1005; Size Code: 0402; Min Operating Temperature: -55°C; Max Operating Temperature: 155°C; Tolerance: 1%; Voltage Rating (DC): 50V; Resistance: 100R; Packaging: Tape and Reel; Termination: SMD/SMT; Resistor Type: Thick Film; Features: Moisture Resistant; Series: RC; Number of Terminations: 2; Resistance Tolerance: 1%; Construction: Rectangular; Technology: THICK FILM; Length: 1mm; Width: 0.5mm; Height: 0.32mm; Depth: 0.5mm; RoHS Compliant: Yes; REACH SVHC: No SVHC; Military Standard: Not; Lead Free: Lead Free; ComponentLink1URL: https://datasheet.ciiva.com/11808/0900766b80c66297-11808765.pdf?src-supplier=RSComponents; ComponentLink1Description: https://datasheet.ciiva.com/11808/0900766b80c66297-11808765.pdf?src-supplier=RSComponents; ComponentLink2URL: https://datasheet.ciiva.com/7849/1784430-7849810.pdf?src-supplier=Element14; ComponentLink2Description: https://datasheet.ciiva.com/7849/1784430-7849810.pdf?src-supplier=Element14; ComponentLink3URL: https://datasheet.ciiva.com/28367/1018594-28367226.pdf?src-supplier=Element14; ComponentLink3Description: https://datasheet.ciiva.com/28367/1018594-28367226.pdf?src-supplier=Element14; ComponentLink4URL: https://datasheet.ciiva.com/22747/1018594-22747511.pdf?src-supplier=Element14; ComponentLink4Description: https://datasheet.ciiva.com/22747/1018594-22747511.pdf?src-supplier=Element14; ComponentLink5URL: https://datasheet.ciiva.com/12667/pyu-rc0402-51-rohs-l-6-r-12667957.pdf?src-supplier=Mouser; ComponentLink5Description: https://datasheet.ciiva.com/12667/pyu-rc0402-51-rohs-l-6-r-12667957.pdf?src-supplier=Mouser; ComponentLink6URL: https://datasheet.ciiva.com/15189/getdatasheetpartid-329466-15189335.pdf?src-supplier=Verical; ComponentLink6Description: https://datasheet.ciiva.com/15189/getdatasheetpartid-329466-15189335.pdf?src-supplier=Verical; ComponentLink7URL: https://datasheet.ciiva.com/16740/pyu-rc0402-51-rohs-l-6-r-16740566.pdf?src-supplier=Future+Electronics; ComponentLink7Description: https://datasheet.ciiva.com/16740/pyu-rc0402-51-rohs-l-6-r-16740566.pdf?src-supplier=Future+Electronics; Supplier Part Number 1: 603-RC0402FR-07100RL; LCSC Part Number: C106232
R?#6 R?#9 = RC0402FR-072K2L: RES SMD 2.2K OHM 1% 1/16W 0402; Manufacturer: Yageo; Resistance: 2.2kR; Power Rating: 63mW; Voltage Rating: 50V; Temperature Coefficient: 100ppm/°C; Supplier 1: Digi-Key; Manufacturer Part Number: RC0402FR-072K2L; Stock 1: 966157; Pricing 1: 1=0.1, 10=0.016, 100=0.0066, 1000=0.00299, 2500=0.00259, 5000=0.00214 (USD); Case/Package: 0402; Case Code (Imperial): 0402; Case Code (Metric): 1005; Weight: 2.3E-05oz; Size Code: 0402; Min Operating Temperature: -55°C; Max Operating Temperature: 155°C; Resistor Type: Thick Film; Packaging: Tape and Reel; Tolerance: 1%; Termination: SMD/SMT; Features: Moisture Resistant; Series: RC; Max Power Dissipation: 63mW; Number of Terminations: 2; Resistance Tolerance: 1%; Construction: Rectangular; Technology: THICK FILM; Length: 1mm; Width: 0.5mm; Height: 0.35mm; Depth: 0.5mm; RoHS Compliant: Yes; REACH SVHC: Unknown; Military Standard: Not; Lead Free: Lead Free; ComponentLink1URL: http://www.farnell.com/datasheets/2167052.pdf?src-supplier=Element14; ComponentLink1Description: http://www.farnell.com/datasheets/2167052.pdf?src-supplier=Element14; ComponentLink2URL: http://www.yageo.com/documents/recent/PYu-RC_Group_51_RoHS_L_9.pdf?src-supplier=Mouser; ComponentLink2Description: http://www.yageo.com/documents/recent/PYu-RC_Group_51_RoHS_L_9.pdf?src-supplier=Mouser; ComponentLink3URL: http://documents.rs-components.com/techlib://itc_doclist_GB.htm?stockno=6186532&src-supplier=RSComponents; ComponentLink3Description: http://documents.rs-components.com/techlib://itc_doclist_GB.htm?stockno=6186532&src-supplier=RSComponents; ComponentLink4URL: http://www.yageo.com/documents/recent/PYu-RC0402_51_RoHS_L_6_r.pdf?src-supplier=Future+Electronics; ComponentLink4Description: http://www.yageo.com/documents/recent/PYu-RC0402_51_RoHS_L_6_r.pdf?src-supplier=Future+Electronics; Supplier Part Number 1: 311-2.20KLRCT-ND; LCSC Part Number: C114762
R?#7 = RT0402BRD0710KL: RES SMD 10K OHM 0.1% 1/16W 0402; Manufacturer: Yageo; Item Type: Resistor; Supplier: Future Electronics; Supplier Part Number: 1236728; Manufacturer Part Number: RT0402BRD0710KL; RoHS: Yes; Category: Chip SMD Resistors; Stock: 490000; Pricing: 10000=0.0218, 20000=0.0213, 30000=0.021, 50000=0.0206, 100000=0.0199 (USD); ComponentLink1URL: https://datasheet.ciiva.com/12836/pyu-rt-1-to-0-05-rohs-l-4-12836454.pdf?src-supplier=Mouser; ComponentLink1Description: https://datasheet.ciiva.com/12836/pyu-rt-1-to-0-05-rohs-l-4-12836454.pdf?src-supplier=Mouser; LCSC Part Number: C190095
R?#10 R?#11 = RC0402FR-0715KL: RES 15K OHM 1% 1/16W 0402; Manufacturer: Yageo; Item Type: Resistor; Power Rating: 62.5mW; Value: 15kR; Voltage Rating: 50V; Temperature Coefficient: 100ppm/°C; Max Power Dissipation: 63mW; Supplier: Future Electronics; Supplier Part Number: 3262151; Manufacturer Part Number: RC0402FR-0715KL; RoHS: Yes; Stock: 1530000; Pricing: 10000=0.0012, 100000=0.0011, 300000=0.001, 750000=0.001, 2000000=0.0009 (USD); Case/Package: 0402; Pins: 2NUMBER; Case Code (Imperial): 0402; Case Code (Metric): 1005; Weight: 2.3E-05oz; Min Operating Temperature: -55°C; Max Operating Temperature: 155°C; Resistor Type: Thick Film; Tolerance: 1%; Packaging: Tape and Reel; Package Quantity: 1; Termination: SMD/SMT; Number of Terminations: 2; Features: Moisture Resistant; Series: RC; Resistance Tolerance: 1%; Technology: THICK FILM; Construction: Rectangular; Voltage Rating (DC): 50V; Length: 1mm; Width: 0.02inch; Height: 0.016inch; Depth: 0.5mm; RoHS Compliant: Yes; Reach SVHC Compliant: No; Military Standard: Not; Lead Free: 5697LeadFree; ComponentLink1URL: https://datasheet.ciiva.com/11808/0900766b80c66297-11808307.pdf?src-supplier=Rs; ComponentLink1Description: https://datasheet.ciiva.com/11808/0900766b80c66297-11808307.pdf?src-supplier=Rs; ComponentLink2URL: https://datasheet.ciiva.com/46394/1018594-46394949.pdf?src-supplier=Element14; ComponentLink2Description: https://datasheet.ciiva.com/46394/1018594-46394949.pdf?src-supplier=Element14; ComponentLink3URL: https://datasheet.ciiva.com/2453/pyu-r-int-thick-7-2453404.pdf?src-supplier=Digikey; ComponentLink3Description: https://datasheet.ciiva.com/2453/pyu-r-int-thick-7-2453404.pdf?src-supplier=Digikey; ComponentLink4URL: https://datasheet.ciiva.com/2453/pyu-r-int-thick-7-2453405.pdf?src-supplier=Digikey; ComponentLink4Description: https://datasheet.ciiva.com/2453/pyu-r-int-thick-7-2453405.pdf?src-supplier=Digikey; ComponentLink5URL: https://datasheet.ciiva.com/2453/pyu-r-int-thick-7-2453403.pdf?src-supplier=Digikey; ComponentLink5Description: https://datasheet.ciiva.com/2453/pyu-r-int-thick-7-2453403.pdf?src-supplier=Digikey; ComponentLink6URL: https://datasheet.ciiva.com/12577/pyu-rc0402-51-rohs-l-6-r-12577610.pdf?src-supplier=Mouser; ComponentLink6Description: https://datasheet.ciiva.com/12577/pyu-rc0402-51-rohs-l-6-r-12577610.pdf?src-supplier=Mouser; ComponentLink7URL: https://datasheet.ciiva.com/17333/pyu-rc0402-51-rohs-l-6-r-17333595.pdf?src-supplier=Future+Electronics; ComponentLink7Description: https://datasheet.ciiva.com/17333/pyu-rc0402-51-rohs-l-6-r-17333595.pdf?src-supplier=Future+Electronics; LCSC Part Number: C114761
R?#12 = RC0402FR-070RL: RES 0 OHM JUMPER 1/16W 0402; Manufacturer: Yageo; Item Type: Resistors; Tolerance: 1%; Power Rating: 62.5mW; Voltage Rating: 50V; Temperature Coefficient: 200ppm/°C; Max Power Dissipation: 63mW; Supplier 1: Mouser; Manufacturer Part Number: RC0402FR-070RL; RoHS: Yes; Stock 1: 8556842; Pricing 1: 1=0.10000, 10=0.01400, 50=0.01400, 100=0.00600, 1000=0.00300, 5000=0.00200, 10000=0.00100 (USD); Mount: Surface Mount; Case/Package: 0402; Contact Plating: Tin,Matte; Case Code (Imperial): 0402; Case Code (Metric): 1005; Size Code: 0402; Min Operating Temperature: -55°C; Max Operating Temperature: 155°C; Resistance: 0R; Resistor Type: Thick Film; Packaging: Tape and Reel; Termination: SMD/SMT; Features: Moisture Resistant; Series: RC; Number of Terminations: 2; Length: 1mm; Width: 0.5mm; Height: 0.35mm; Radiation Hardening: No; Lead Free: Lead Free; RoHS Compliant: Yes; ComponentLink1URL: https://datasheet.ciiva.com/8896/pyu-rc0402-51-rohs-l-6-8896149.pdf?src-supplier=Avnet; ComponentLink1Description: https://datasheet.ciiva.com/8896/pyu-rc0402-51-rohs-l-6-8896149.pdf?src-supplier=Avnet; ComponentLink2URL: https://datasheet.ciiva.com/16790/pyu-rc0402-51-rohs-l-6-r-16790444.pdf?src-supplier=Future+Electronics; ComponentLink2Description: https://datasheet.ciiva.com/16790/pyu-rc0402-51-rohs-l-6-r-16790444.pdf?src-supplier=Future+Electronics; Supplier Part Number 1: 603-RC0402FR-070RL; LCSC Part Number: C106231
TP?#1-TP?#3 = TEST POINT: Test Point ON; Item Type: TEST POINT
U?#1 = SQJ886EP-T1_GE3: MOSFET N-CH 40V 60A PPAK SO-8; Manufacturer: Vishay Siliconix; Item Type: IC; Supplier: Mouser; Supplier Part Number: 781-SQJ886EP-T1_GE3; Manufacturer Part Number: SQJ886EP-T1_GE3; RoHS: Yes; Category: MOSFETs; Stock: 59592; Pricing: 1=1.5, 10=1.24, 50=1.24, 100=0.959, 1000=0.662, 10000=0.565 (USD); ComponentLink1URL: https://datasheet.ciiva.com/28599/1760631-28599527.pdf?src-supplier=Element14; ComponentLink1Description: https://datasheet.ciiva.com/28599/1760631-28599527.pdf?src-supplier=Element14; ComponentLink2URL: https://datasheet.ciiva.com/30021/sqj886ep-30021665.pdf?src-supplier=Avnet; ComponentLink2Description: https://datasheet.ciiva.com/30021/sqj886ep-30021665.pdf?src-supplier=Avnet; LCSC Part Number: C727822
U?#2 = SY8370TMC: Step-down type Adjustable 1.2V 4V~24V 11A QFN-13(3x4) DC-DC Converters ROHS; Manufacturer: Silergy Corp; Item Type: IC; Manufacturer Part Number: SY8370TMC; Package: QFN-13(3x4); LCSC Part Number: C3029744; ComponentLink1Description: LCSC; ComponentLink1URL: https://www.lcsc.com/product-detail/DC-DC-Converters_Silergy-Corp-SY8370TMC_C3029744.html
U?#3 = LM74700QDBVRQ1: OR Controller N+1 ORing Controller N-Channel 1:1 SOT-23-6; Manufacturer: Texas Instruments; Max Output current: 5A; Turn-On Delay Time: 1.4us; Turn-Off Delay Time: 450ns; Max Supply Voltage: 65V; Min Supply Voltage: 3.2V; Nominal Supply Current: 80uA; Number of Outputs: 1NUMBER; Item Type: IC; Supplier: Mouser; Supplier Part Number: 595-LM74700QDBVRQ1; Manufacturer Part Number: LM74700QDBVRQ1; RoHS: Yes; Category: Power Management ICs; Stock: 11505; Pricing: 1=1.78, 10=1.6, 50=1.6, 100=1.28, 1000=0.877, 10000=0.756 (USD); Mounting Technology: Surface Mount; Case/Package: SOT-23-6; Pins: 6NUMBER; Min Operating Temperature: -40°C; Max Operating Temperature: 125°C; Series: Automotive, AEC-Q100; Length: 2.9mm; Width: 1.6mm; Height: 1.45mm; Thickness: 1.2mm; RoHS Compliant: Yes; ComponentLink1URL: http://www.ti.com/general/docs/suppproductinfo.tsp?distId=10&amp;gotoUrl=http%3A%2F%2Fwww.ti.com%2Flit%2Fgpn%2Flm74700-q1&src-supplier=Digikey; ComponentLink1Description: http://www.ti.com/general/docs/suppproductinfo.tsp?distId=10&amp;gotoUrl=http%3A%2F%2Fwww.ti.com%2Flit%2Fgpn%2Flm74700-q1&src-supplier=Digikey; LCSC Part Number: C2941042
U?#4 = AP3441SHE-7B: IC REG BUCK ADJ 3A UDFN20208; Manufacturer: Diodes; Supplier: Digikey; LCSC Part Number: C2070918; Manufacturer Part Number: AP3441SHE-7B; RoHS: Yes; Item Type: IC; Stock: 2949; Pricing: 1=0.72, 10=0.43, 25=0.3544, 100=0.2688, 250=0.22676, 500=0.20086, 1000=0.17916 (USD); RoHS Compliant: Yes
U?#5 = AP22653W6-7: Power Switch/Driver 1:1 P-Channel 2.1A SOT-26; Manufacturer: Diodes; Item Type: USB Interface ICs; Interface: On/Off; Fault Protection: Over Voltage,Over Temperature,Short Circuit,Reverse Current; Number of Outputs: 1; Output Configuration: High Side; Max Supply Voltage: 5.5V; Min Supply Voltage: 3V; Number of Channels: 1NUMBER; Supplier: Avnet; LCSC Part Number: C2158037; Manufacturer Part Number: AP22653W6-7; RoHS: Yes; Stock: 150000; Pricing: 3000=0.1127, 6000=0.11213, 12000=0.11155, 18000=0.11098, 24000=0.1104 (USD); Mounting Technology: Surface Mount; Case/Package: SOT-23-6; Min Operating Temperature: -40°C; Max Operating Temperature: 85°C; Series: -; Max Output current: 2.1A; Output Current: 2.1A; Height: 1.4mm; ComponentLink1URL: https://datasheet.octopart.com/AP22653W6-7-Diodes-Inc.-datasheet-151209788.pdf?src-supplier=Future+Electronics; ComponentLink1Description: https://datasheet.octopart.com/AP22653W6-7-Diodes-Inc.-datasheet-151209788.pdf?src-supplier=Future+Electronics; ComponentLink2URL: https://www.diodes.com/assets/Datasheets/AP22652_53_52A_53A.pdf?src-supplier=Digikey; ComponentLink2Description: https://www.diodes.com/assets/Datasheets/AP22652_53_52A_53A.pdf?src-supplier=Digikey
U?#6 = BD2220G-TR: IC PWR SWITCH N-CHAN 1:1 5SSOP; Manufacturer: Rohm; Supplier: Mouser; LCSC Part Number: C5362383; Manufacturer Part Number: BD2220G-TR; RoHS: Yes; Item Type: IC; Stock: 1594; Pricing: 1=0.86, 10=0.617, 50=0.556, 100=0.489, 1000=0.407, 10000=0.371 (USD); ComponentLink1URL: http://www.mouser.com/ds/2/348/bd2220g-e-372128.pdf?src-supplier=Mouser; ComponentLink1Description: http://www.mouser.com/ds/2/348/bd2220g-e-372128.pdf?src-supplier=Mouser; ComponentLink2URL: http://rohmfs.rohm.com/en/products/databook/datasheet/ic/power/power_switch/bd2220g-e.pdf?src-supplier=Digikey; ComponentLink2Description: http://rohmfs.rohm.com/en/products/databook/datasheet/ic/power/power_switch/bd2220g-e.pdf?src-supplier=Digikey; ComponentLink3URL: http://rohmfs.rohm.com/en/products/databook/datasheet/ic/power/power_switch/bd2220g-e.pdf?src-supplier=Avnet; ComponentLink3Description: http://rohmfs.rohm.com/en/products/databook/datasheet/ic/power/power_switch/bd2220g-e.pdf?src-supplier=Avnet